# Altium schematic sheet Actual_Prototype.SchDoc
size Legal; SheetNumber: 1; SheetTotal: 2
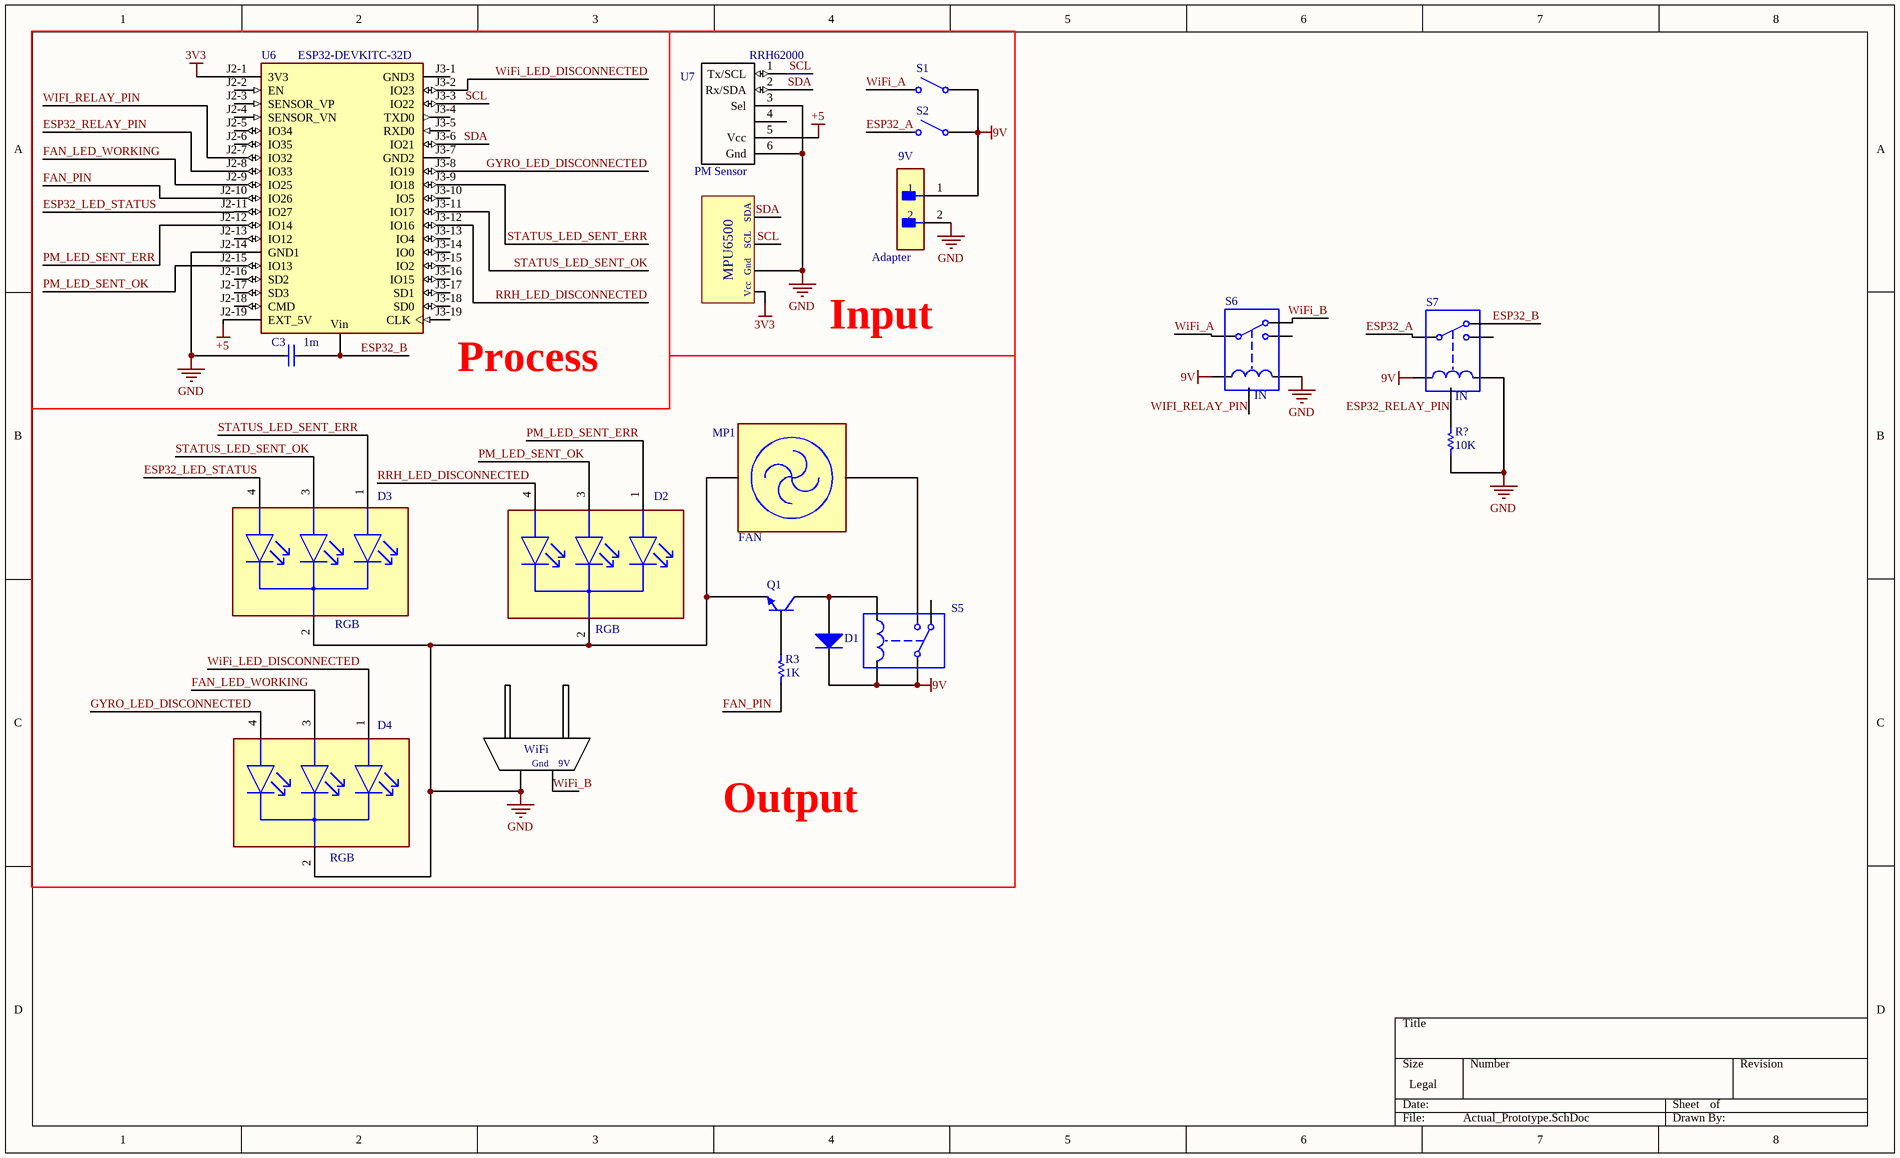
[diagram p0: Actual_Prototype.SchDoc]

## Parts
Adapter  9V  [FP-TSW-102-22-G-S-MFG]
C3  value 1m  (hidden comment: Capacitor)
D1  Diode  (value not drawn)
D2  RGB  [FP-AAA3528LSEKJ3ZGKQBKS-MFG]
D3  RGB  [FP-AAA3528LSEKJ3ZGKQBKS-MFG]
D4  RGB  [FP-AAA3528LSEKJ3ZGKQBKS-MFG]
MP1  FAN  [FP-CFM-6015V-154-362-MFG]
Q1  Bipolar NPN 3 Pins Transistor VBIC Model  (value not drawn)
R3  value 1K  (hidden comment: Resistor)
R?  value 10K  (hidden comment: Resistor)
S1  Single-Pole, Single-Throw Switch  (value not drawn)
S2  Single-Pole, Single-Throw Switch  (value not drawn)
S5  Single-Pole, Double-Throw Relay  (value not drawn)
S6  Single-Pole, Double-Throw Relay  (value not drawn)
S7  Single-Pole, Double-Throw Relay  (value not drawn)
U6  ESP32-DEVKITC-32D  [MODULE_ESP32-DEVKITC-32D]
U7  PM Sensor  [RRH62000]

## Blocks framed on the sheet
Process: C3 U6

## Nets
3V3: U6.J2-1(3V3)
9V: Adapter.1 D1.2(K) S1.1 S2.1 S5.1 S5.4 S6.4 S7.4
+5: U6.J2-19(EXT_5V) U7.5(Vcc)
GND: Adapter.2 C3.1 D2.2(COMMON_CATHODE) D3.2(COMMON_CATHODE) D4.2(COMMON_CATHODE) Q1.3(E) R?.2 S6.5 S7.5 U6.J2-14(GND1) U7.3(Sel) U7.6(Gnd)
ESP32_A: S2.2 S7.1
ESP32_B: C3.2 S7.3
ESP32_LED_STATUS: D3.4(ANODE_BLUE) U6.J2-11(IO27)
ESP32_RELAY_PIN: R?.1 U6.J2-8(IO33)
FAN_LED_WORKING: D4.3(ANODE_GREEN) U6.J2-9(IO25)
FAN_PIN: R3.1 U6.J2-10(IO26)
GYRO_LED_DISCONNECTED: D4.4(ANODE_BLUE) U6.J3-8(IO19)
PM_LED_SENT_ERR: D2.1(ANODE_RED) U6.J2-12(IO14)
PM_LED_SENT_OK: D2.3(ANODE_GREEN) U6.J2-15(IO13)
RRH_LED_DISCONNECTED: D2.4(ANODE_BLUE) U6.J3-12(IO16)
SCL: U6.J3-3(IO22) U7.1(Tx/SCL)
SDA: U6.J3-6(IO21) U7.2(Rx/SDA)
STATUS_LED_SENT_ERR: D3.1(ANODE_RED) U6.J3-9(IO18)
STATUS_LED_SENT_OK: D3.3(ANODE_GREEN) U6.J3-11(IO17)
WiFi_A: S1.2 S6.1
WiFi_B: S6.3
WiFi_LED_DISCONNECTED: D4.1(ANODE_RED) U6.J3-2(IO23)
WIFI_RELAY_PIN: U6.J2-7(IO32)
NetD1_1: D1.1(A) Q1.1(C) S5.5
NetQ1_2: Q1.2(B) R3.2

Not connected (* = marked no-connect by the designer): S5 2 3; S6 2; S7 2; U6 J2-2(EN) J2-3(SENSOR_VP) J2-4(SENSOR_VN) J2-5(IO34) J2-6(IO35) J2-13(IO12) J2-16(SD2) J2-17(SD3) J2-18(CMD) J3-1(GND3) J3-4(TXD0) J3-5(RXD0) J3-7(GND2) J3-10(IO5) J3-13(IO4) J3-14(IO0) J3-15(IO2) J3-16(IO15) J3-17(SD1) J3-18(SD0) J3-19(CLK); U7 4

## Notes on the sheet
- SDA
- MPU6500
- Vcc
- Gnd
- SCL
- (near U6) Vin
- Input
- (near S6) IN
- IN
- WiFi
- 9V
- Output

## Library data of the parts
Adapter = CMP-02766-000117-1: CONN HEADER VERT 2POS 2.54MM; Max Voltage Rating (AC): 550V; Gender: Male; Max Current Rating: 7.6A; Number of Contacts: 2; Housing Color: Black; Max Operating Temperature: 125°C; Orientation: Straight; Depth: 2.54mm; Pitch: 2.54mm; Housing Material: Polyester; Packaging: Bulk; Termination: Solder; Contact Plating: Gold; Length: 5.08mm; Number of Rows: 1; Radiation Hardening: No; Min Operating Temperature: -55°C; REACH SVHC: No SVHC; Contact Material: Bronze
C3 = Capacitor: SimulationGenericComponent: True
D1 = Diode: AF: 1; BV: 0; BV_MAX: 1e99; EG: 1.11; FC: 0.5; IBV: 0.001; ISR: 1e-14; MJSW: 0.33; NTUN: 30; TNOM: 27; XTI: 3; SimulationGenericComponent: True; CJO: 0; CJP: 0; CTA: 0; CTP: 0; FCS: 0.5; FV_MAX: 1e99; IKF: 0; IKR: 0; JSW: 0; JTUN: 0; JTUNSW: 0; KEG: 1; KF: 0; LEVEL: 1; N: 1; NBV: 1; NR: 1; NS: 1; PHP: 1; RS: 0; TCV: 0; TLEV: 0; TLEVC: 0; TM1: 0; TM2: 0; TPB: 0; TPHP: 0; TRS: 0; TRS2: 0; TT: 0; TTT1: 0; TTT2: 0; VJ: 1; XTITUN: 3; IS: 1e-14
D2-D4 = CMP-44529-000057-1: LED RGB CLEAR 4SMD; Forward Voltage: 2.7V; Lens Color: Colorless; Luminous Intensity: 30mcd; Viewing Angle: 120°; Color: Blue; Test Current: 2mA; Dominant Wavelength: 465nm; Packaging: Tape and Reel; Width: 2.8mm; Height: 2.1mm; Lens Transparency: Clear; Mount: Surface Mount; Case/Package: PLCC; Length: 3.2mm; RoHS Compliant: Yes
MP1 = CMP-12637-106233381-1: CFM-6015V-154-362 DC Fan Axial omniCOOL Bearing 12V 4.5V to 13.8V 30.4CFM 36.2dB 60 X 60 X 15mm; Max Input Current: 213mA; RoHS: Non-Compliant; Airflow: 30.4CFM; Lifecycle Status: Production; Length: 60mm; Schedule B: 8414599080; Max Operating Temperature: 70°C; NexarPartId: 106233381; Width: 60mm; Voltage Rating: 12V; Height: 15mm; Min Operating Temperature: -10°C
Q1 = BJT NPN VBIC: SimulationGenericComponent: True; AFN: 1; AJC: -0.5; ART: 0.1; AVC1: 0; EA: 1.12; FC: 0.9; IBBE: 1e-06; IBCI: 1e-16; IBEI: 1e-18; MC: 0.33; NCN: 2; NKF: 0.5; PC: 0.75; TNOM: 27; VERS: 1.2; XII: 3; AJE: -0.5; AJS: -0.5; AVC2: 0; BFN: 1; CBCO: 0; CBEO: 0; CCSO: 0; CJC: 0; CJCP: 0; CJE: 0; CJEP: 0; CTH: 0; DEAR: 0; EAIC: 1.12; EAIE: 1.12; EAIS: 1.12; EANC: 1.12; EANE: 1.12; EANS: 1.12; EAP: 1.12; EBBE: 0; GAMM: 0; HRCF: 1; IBCIP: 0; IBCN: 0; IBCNP: 0; IBEIP: 0; IBEN: 0; IBENP: 0; IKF: 0; IKP: 0; IKR: 0; IS: 1e-16; ISP: 0; ISRR: 1; ITF: 0; KFN: 0; ME: 0.33; MS: 0.33; NBBE: 1; NCI: 1; NCIP: 1; NCNP: 2; NEI: 1; NEN: 2; NF: 1; NFP: 1; NR: 1; PE: 0.75; PS: 0.75; QBM: 0; QCO: 0; QTF: 0; RBI: 0.1; RBP: 0.1; RBX: 0; RCI: 0.1; RCX: 0; RE: 0; RS: 0; RTH: 0; TAVC: 0; TD: 0; TF: 0; TNBBE: 0; TNF: 0; TR: 0; TVBBE1: 0; TVBBE2: 0; VBBE: 0; VEF: 0; VER: 0; VO: 0; VREF: 0; VRT: 0; VTF: 0; WBE: 1; WSP: 1; XIKF: 0; XIN: 3; XIS: 3; XISR: 0; XRBI: 0; XRBP: 0; XRBX: 0; XRCI: 0; XRCX: 0; XRE: 0; XRS: 0; XTF: 0; XVO: 0
R3 R? = Resistor: TC1: 0; SimulationGenericComponent: True; TC2: 0
S1 S2 = SPST SW: closed: 0; Rclosed: 1m; Ropen: 1Meg; SimulationGenericComponent: True
S5-S7 = SPDT Relay: L_C: 1u; R_C: 100; RON: 1; ROFF: 1e12; ION: 1m; IOFF: 0; SimulationGenericComponent: True
U6 = ESP32-DEVKITC-32D: WiFi Development Tools (802.11) ESP32 General Development Kit, ESP32-WROOM-32D on the board; MF: Espressif Systems; SnapEDA_Link: https://www.snapeda.com/parts/ESP32-DEVKITC-32D/Espressif+Systems/view-part/?ref=snap; Package: None; Value: *; MP: ESP32-DEVKITC-32D; Check_prices: https://www.snapeda.com/parts/ESP32-DEVKITC-32D/Espressif+Systems/view-part/?ref=eda
U7 = RRH62000